# Altium schematic sheet PreAmli.SchDoc
size A4; SheetNumber: 2; SheetTotal: 5
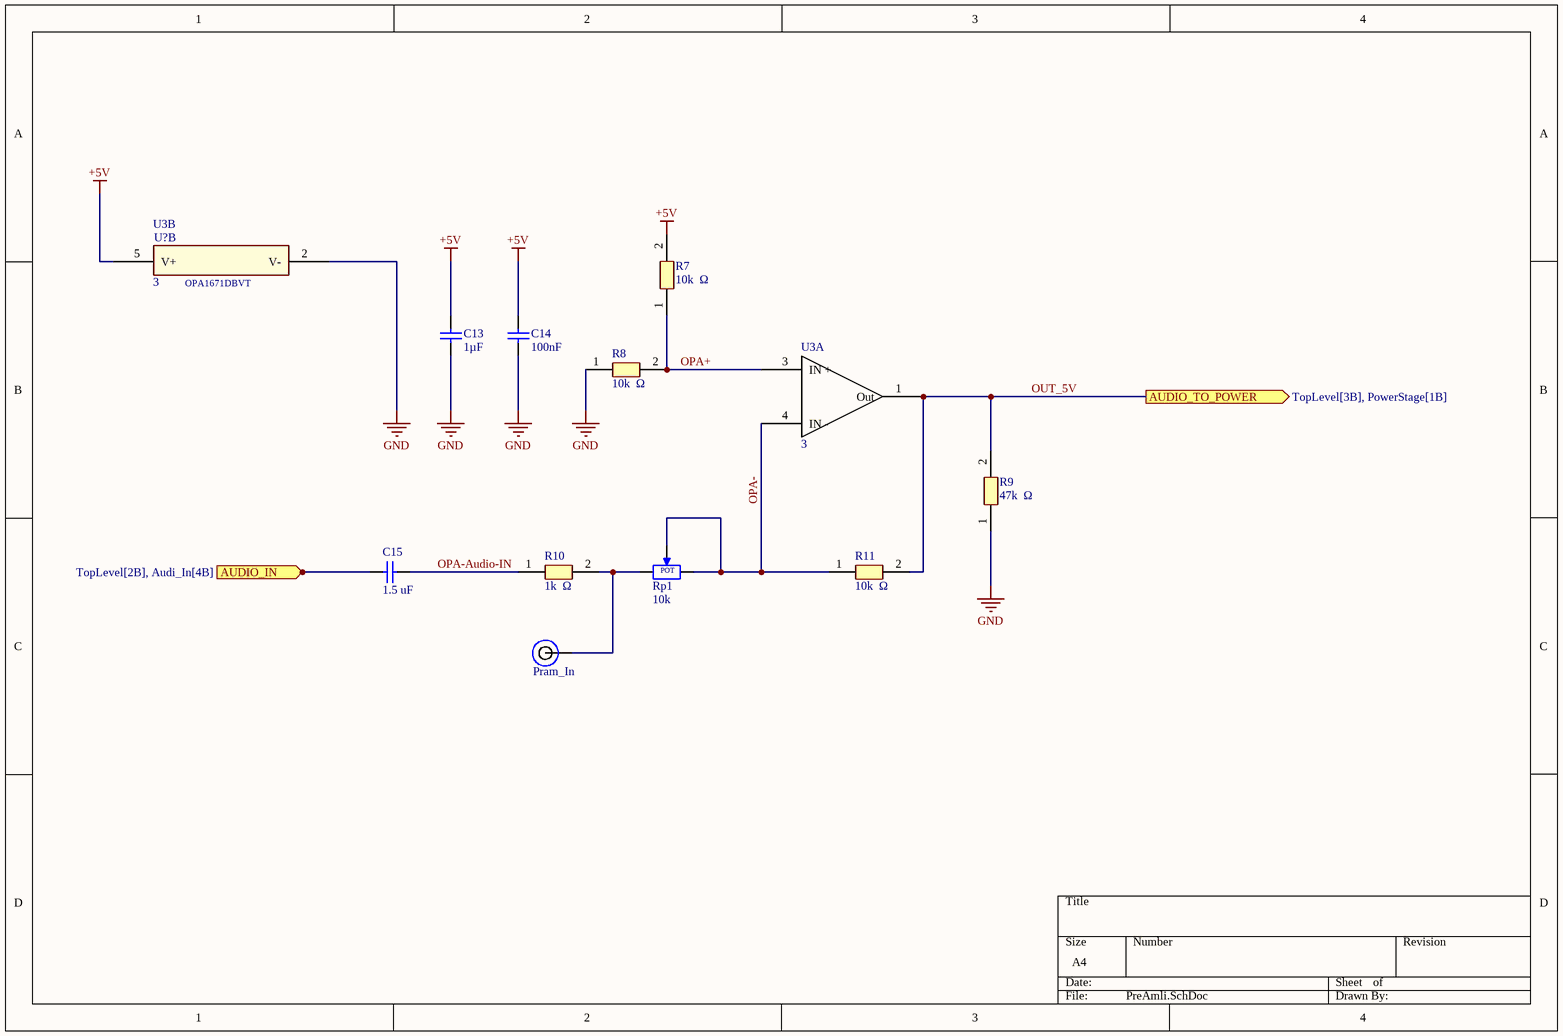
[diagram p0: PreAmli.SchDoc]

## Parts
C13  1µF  [CAPACITOR_1206]
C14  100nF  [CAPACITOR_1206]
C15  1.5 uF  [CAPACITOR_1206]
R7  10k  Ω  [RESISTOR_1206]
R8  10k  Ω  [RESISTOR_1206]
R9  47k  Ω  [RESISTOR_1206]
R10  1k  Ω  [RESISTOR_1206]
R11  10k  Ω  [RESISTOR_1206]
Rp1  10k  [3362P]
T1  Pram_In  [Test Point 1.32mm]
U3  3  [AOP-1671IDBVR]  (parts A,B of 2)

## Ports
AUDIO_IN (in, see TopLevel[2B], Audi_In[4B]), AUDIO_TO_POWER (out, see TopLevel[3B], PowerStage[1B])

## Nets
+5V: C13.2 C14.2 R7.2 U3.5(V+)
GND: C13.1 C14.1 R8.1 R9.1 U3.2(V-)
AUDIO_IN: C15.1 ; port AUDIO_IN
OPA+: R7.1 R8.2 U3.3(IN_+)
OPA-: R11.1 Rp1.2(cathode) Rp1.3(cathode) U3.4(IN_-)
OPA-Audio-IN: C15.2 R10.1
OUT_5V: R9.2 R11.2 U3.1(Out) ; port AUDIO_TO_POWER
NetR10_2: R10.2 Rp1.1(Anode) T1.1

## Notes on the sheet
- (in symbol OPA1671DBVT, part B) U?B
- (in symbol Potentiometer) POT

## Library data of the parts
C13 C15 = Capacitor: Rated Voltage: 100 V; Value: 100nF; Case-Metric: 3216; Case-EIA: 1206; Tolerance: Â±5%; Technology: SMT; Max Thickness: 1.7 mm
C14 = Capacitor: Rated Voltage: 100 V; Case-Metric: 3216; Case-EIA: 1206; Tolerance: Â±5%; Technology: SMT; Value: 100nF; Max Thickness: 1.7 mm
R7-R11 = Resistor: Résistance
Rp1 = Potentiometer: Manufacturer: *; Manufacturer Part Number: *; Supplier: *; Supplier Part Number: *; Supplier Unit Price: *; MOQ: *
T1 = Test Point: PCB Test Point, Type 8 Series, Black, Through Hole Mount, 1.32 mm, Phosphor Bronze; Manufacturer: VERO; Manufacturer Part Number: 20-2136; Supplier Part Number: 8731195; Supplier: Farnell; Supplier Unit Price: 0.132; MOQ: 100
U3 = OPA1671DBVT: AOP